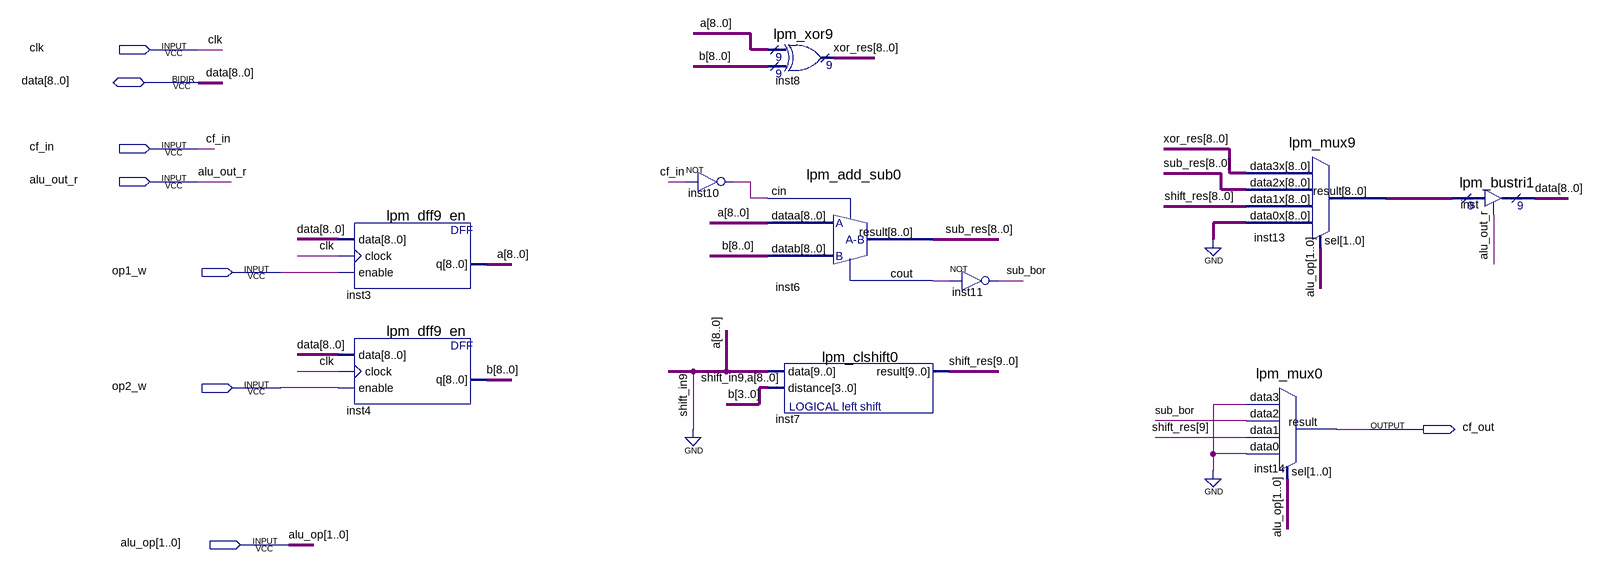
[diagram p0: schematic sheet]
// Quartus schematic alu.bdf as structural Verilog: 10 symbols, 8 pins
module alu (
  input  clk,
  input  cf_in,
  input  alu_out_r,
  input  op1_w,
  input  op2_w,
  input  [1:0] alu_op,
  inout  [8:0] data,
  output cf_out
);

  wire inst6_cout, inst10_out, sub_bor;
  wire [8:0] a, b, inst13_result, sub_res, xor_res;
  wire [9:0] shift_res;

  lpm_dff9_en inst3 (.data(data), .clock(clk), .enable(op1_w), .q(a));
  lpm_dff9_en inst4 (.data(data), .clock(clk), .enable(op2_w), .q(b));
  not inst10 (inst10_out, cf_in);
  lpm_xor9 inst8 (.data0x(a), .data1x(b), .result(xor_res));
  lpm_add_sub0 inst6 (.dataa(a), .datab(b), .cin(inst10_out), .result(sub_res), .cout(inst6_cout));
  lpm_clshift0 inst7 (.data({1'b0, a}), .distance(b[3:0]), .result(shift_res));
  not inst11 (sub_bor, inst6_cout);
  lpm_mux9 inst13 (
    .data3x(xor_res), .data2x(sub_res), .data1x(shift_res[8:0]), .data0x({9{1'b0}}), .sel(alu_op),
    .result(inst13_result));
  lpm_mux0 inst14 (.data3(1'b0), .data2(sub_bor), .data1(shift_res[9]), .data0(1'b0), .sel(alu_op), .result(cf_out));
  lpm_bustri1 inst (.enabledt(alu_out_r), .data(inst13_result), .tridata(data));
endmodule
